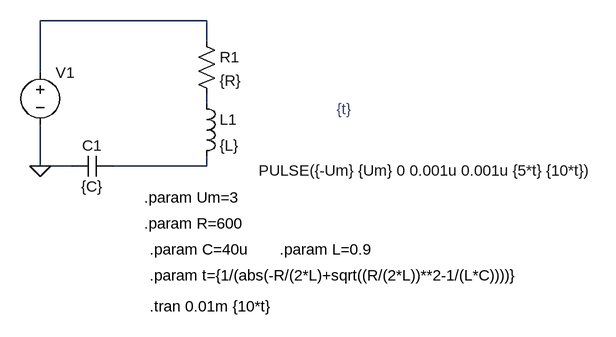
[diagram p0: schematic LAB2.3.asc]
LAB2.3.asc, the LTspice schematic file:
Version 4.1
SHEET 1 928 680
WIRE 240 0 -16 0
WIRE 240 32 240 0
WIRE -16 80 -16 0
WIRE 240 128 240 112
WIRE -16 224 -16 160
WIRE 32 224 -16 224
WIRE 240 224 240 208
WIRE 240 224 96 224
FLAG -16 224 0
SYMBOL res 224 16 R0
SYMATTR InstName R1
SYMATTR Value {R}
SYMBOL voltage -16 64 R0
WINDOW 3 336 167 Left 2
WINDOW 123 0 0 Left 0
WINDOW 39 0 0 Left 0
SYMATTR InstName V1
SYMATTR Value PULSE({-Um} {Um} 0 0.001u 0.001u {5*t} {10*t})
SYMBOL ind 224 112 R0
SYMATTR InstName L1
SYMATTR Value {L}
SYMATTR SpiceLine Rser=1m
SYMBOL cap 96 208 R90
WINDOW 0 0 32 VBottom 2
WINDOW 3 32 32 VTop 2
SYMATTR InstName C1
SYMATTR Value {C}
TEXT 144 272 Left 2 !.param Um=3
TEXT 144 312 Left 2 !.param R=600
TEXT 152 352 Left 2 !.param C=40u
TEXT 152 392 Left 2 !.param t={1/(abs(-R/(2*L)+sqrt((R/(2*L))**2-1/(L*C))))}
TEXT 152 440 Left 2 !.tran 0.01m {10*t}
TEXT 352 352 Left 2 !.param L=0.9
TEXT 440 136 Left 2 ;{t}

The netlist it stands for:
* LAB2.3.asc
R1 N001 N002 {R}
V1 N001 0 PULSE({-Um} {Um} 0 0.001u 0.001u {5*t} {10*t})
L1 N002 N003 {L} Rser=1m
C1 N003 0 {C}
.param Um=3
.param R=600
.param C=40u
.param t={1/(abs(-R/(2*L)+sqrt((R/(2*L))**2-1/(L*C))))}
.tran 0.01m {10*t}
.param L=0.9
* {t}
.backanno
.end